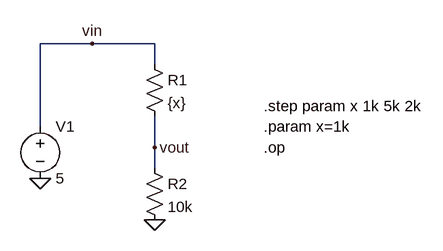
[diagram p0: schematic r_divider_sweep.asc]
r_divider_sweep.asc, the LTspice schematic file:
Version 4.1
SHEET 1 880 680
WIRE 224 -16 144 -16
WIRE 320 -16 224 -16
WIRE 320 16 320 -16
WIRE 144 112 144 -16
WIRE 320 144 320 96
WIRE 320 176 320 144
FLAG 144 192 0
FLAG 320 256 0
FLAG 224 -16 vin
FLAG 320 144 vout
SYMBOL voltage 144 96 R0
WINDOW 123 0 0 Left 0
WINDOW 39 0 0 Left 0
SYMATTR InstName V1
SYMATTR Value 5
SYMBOL res 304 0 R0
SYMATTR InstName R1
SYMATTR Value {x}
SYMBOL res 304 160 R0
SYMATTR InstName R2
SYMATTR Value 10k
TEXT 488 144 Left 2 !.op
TEXT 488 112 Left 2 !.param x=1k
TEXT 488 80 Left 2 !.step param x 1k 5k 2k

The netlist it stands for:
* r_divider_sweep.asc
V1 vin 0 5
R1 vin vout {x}
R2 vout 0 10k
.op
.param x=1k
.step param x 1k 5k 2k
.backanno
.end